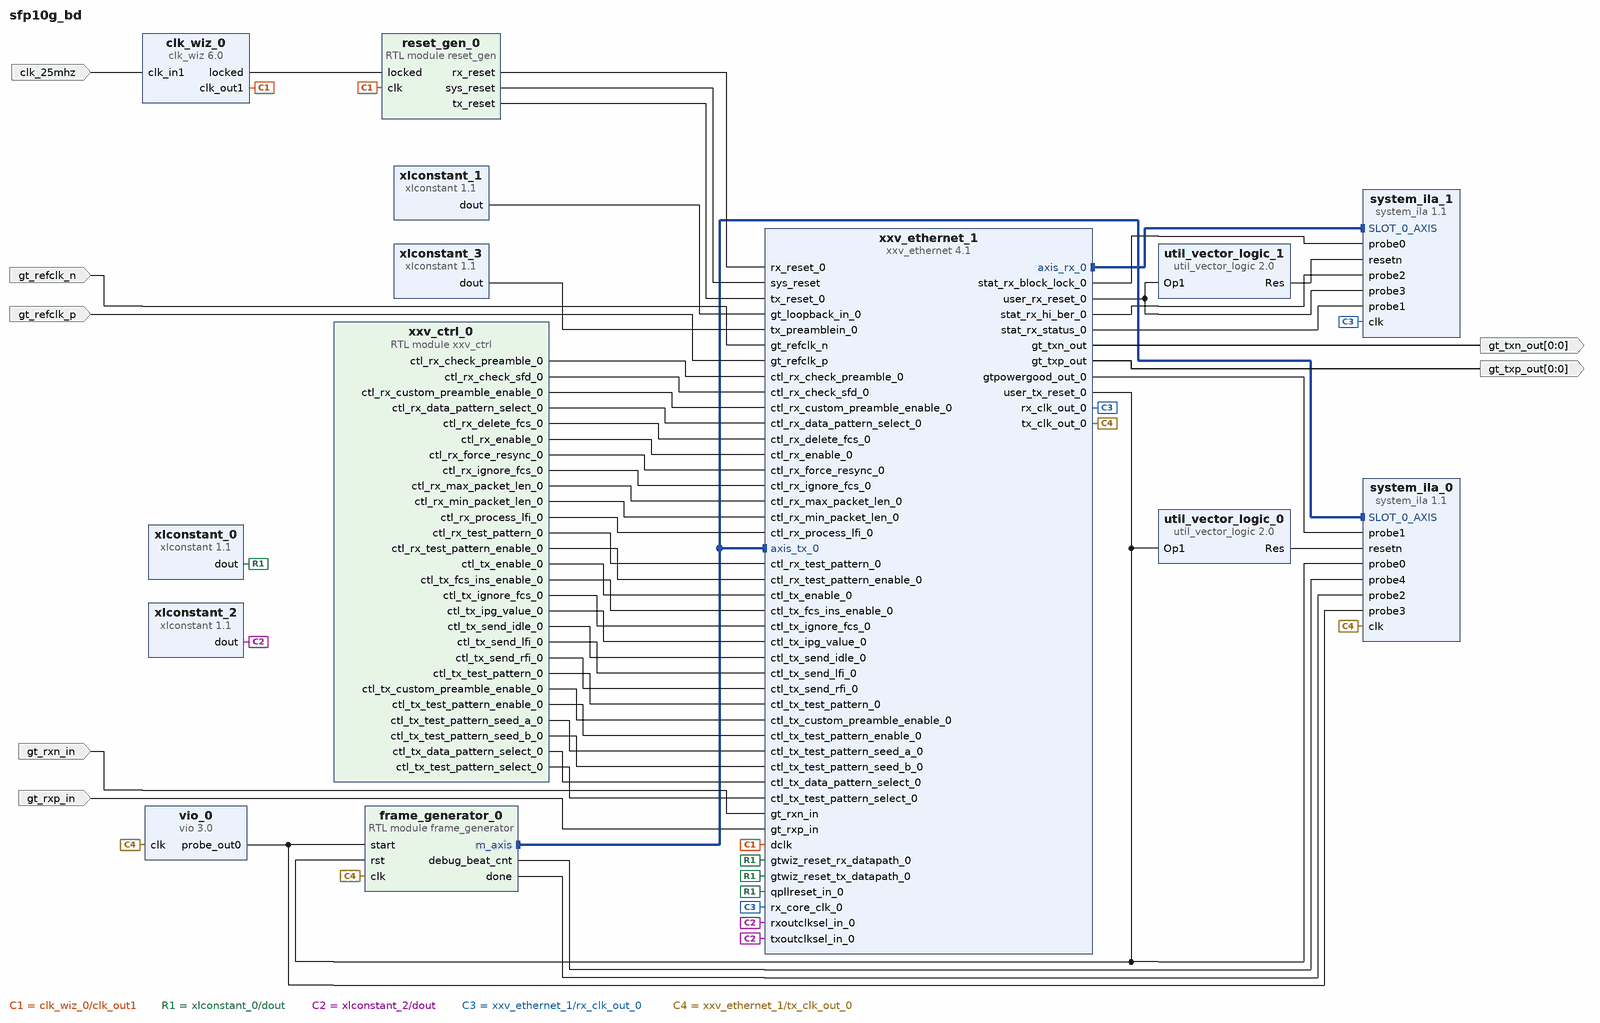
[diagram p0: block diagram of the top level]
# Vivado block design sfp10g_bd, xck26-sfvc784-2LV-c, Vivado 2022.2
create_bd_design sfp10g_bd

create_bd_port -dir I -type clk clk_25mhz
set_property -dict {CONFIG.FREQ_HZ 25000000} [get_bd_ports clk_25mhz]
create_bd_port -dir I -type clk gt_refclk_n
set_property -dict {CONFIG.FREQ_HZ 156250000} [get_bd_ports gt_refclk_n]
create_bd_port -dir I -type clk gt_refclk_p
set_property -dict {CONFIG.FREQ_HZ 156250000} [get_bd_ports gt_refclk_p]
create_bd_port -dir I gt_rxn_in
create_bd_port -dir I gt_rxp_in
create_bd_port -dir O -from 0 -to 0 gt_txn_out
create_bd_port -dir O -from 0 -to 0 gt_txp_out

create_bd_cell -type ip -vlnv xilinx.com:ip:clk_wiz:6.0 clk_wiz_0
set_property -dict [list \
  CONFIG.CLKIN1_JITTER_PS 400.0 \
  CONFIG.CLKOUT1_JITTER 190.517 \
  CONFIG.CLKOUT1_PHASE_ERROR 222.305 \
  CONFIG.MMCM_CLKFBOUT_MULT_F 48.000 \
  CONFIG.MMCM_CLKIN1_PERIOD 40.000 \
  CONFIG.MMCM_CLKIN2_PERIOD 10.0 \
  CONFIG.PRIM_IN_FREQ 25 \
  CONFIG.USE_LOCKED true \
  CONFIG.USE_RESET false \
] [get_bd_cells clk_wiz_0]
create_bd_cell -type module -reference reset_gen reset_gen_0
create_bd_cell -type ip -vlnv xilinx.com:ip:xlconstant:1.1 xlconstant_0
set_property -dict {CONFIG.CONST_VAL 0} [get_bd_cells xlconstant_0]
create_bd_cell -type ip -vlnv xilinx.com:ip:xlconstant:1.1 xlconstant_1
set_property -dict {CONFIG.CONST_VAL 0 CONFIG.CONST_WIDTH 3} [get_bd_cells xlconstant_1]
create_bd_cell -type ip -vlnv xilinx.com:ip:xlconstant:1.1 xlconstant_2
set_property -dict {CONFIG.CONST_VAL b101 CONFIG.CONST_WIDTH 3} [get_bd_cells xlconstant_2]
create_bd_cell -type ip -vlnv xilinx.com:ip:xlconstant:1.1 xlconstant_3
set_property -dict {CONFIG.CONST_VAL 0 CONFIG.CONST_WIDTH 56} [get_bd_cells xlconstant_3]
create_bd_cell -type module -reference xxv_ctrl xxv_ctrl_0
create_bd_cell -type ip -vlnv xilinx.com:ip:xxv_ethernet:4.1 xxv_ethernet_1
set_property -dict [list \
  CONFIG.BASE_R_KR BASE-R \
  CONFIG.INCLUDE_AXI4_INTERFACE 0 \
  CONFIG.LANE1_GT_LOC X0Y6 \
] [get_bd_cells xxv_ethernet_1]
create_bd_cell -type ip -vlnv xilinx.com:ip:vio:3.0 vio_0
set_property -dict {CONFIG.C_NUM_PROBE_IN 0} [get_bd_cells vio_0]
create_bd_cell -type ip -vlnv xilinx.com:ip:system_ila:1.1 system_ila_0
set_property -dict [list \
  CONFIG.C_DATA_DEPTH 4096 \
  CONFIG.C_MON_TYPE MIX \
  CONFIG.C_NUM_OF_PROBES 5 \
  CONFIG.C_SLOT_0_INTF_TYPE xilinx.com:interface:axis_rtl:1.0 \
] [get_bd_cells system_ila_0]
create_bd_cell -type ip -vlnv xilinx.com:ip:system_ila:1.1 system_ila_1
set_property -dict [list \
  CONFIG.C_DATA_DEPTH 4096 \
  CONFIG.C_MON_TYPE MIX \
  CONFIG.C_NUM_OF_PROBES 4 \
  CONFIG.C_SLOT_0_INTF_TYPE xilinx.com:interface:axis_rtl:1.0 \
] [get_bd_cells system_ila_1]
create_bd_cell -type ip -vlnv xilinx.com:ip:util_vector_logic:2.0 util_vector_logic_0
set_property -dict {CONFIG.C_OPERATION not CONFIG.C_SIZE 1} [get_bd_cells util_vector_logic_0]
create_bd_cell -type ip -vlnv xilinx.com:ip:util_vector_logic:2.0 util_vector_logic_1
set_property -dict {CONFIG.C_OPERATION not CONFIG.C_SIZE 1} [get_bd_cells util_vector_logic_1]
create_bd_cell -type module -reference frame_generator frame_generator_0

# ---- connections ----

connect_bd_intf_net [get_bd_intf_pins xxv_ethernet_1/axis_tx_0] [get_bd_intf_pins frame_generator_0/m_axis]
connect_bd_intf_net [get_bd_intf_pins xxv_ethernet_1/axis_tx_0] [get_bd_intf_pins system_ila_0/SLOT_0_AXIS]
connect_bd_intf_net [get_bd_intf_pins xxv_ethernet_1/axis_rx_0] [get_bd_intf_pins system_ila_1/SLOT_0_AXIS]
connect_bd_net [get_bd_ports clk_25mhz] [get_bd_pins clk_wiz_0/clk_in1]
connect_bd_net [get_bd_pins clk_wiz_0/clk_out1] [get_bd_pins reset_gen_0/clk] [get_bd_pins xxv_ethernet_1/dclk]
connect_bd_net [get_bd_pins clk_wiz_0/locked] [get_bd_pins reset_gen_0/locked]
connect_bd_net [get_bd_pins frame_generator_0/debug_beat_cnt] [get_bd_pins system_ila_0/probe4]
connect_bd_net [get_bd_pins frame_generator_0/done] [get_bd_pins system_ila_0/probe2]
connect_bd_net [get_bd_ports gt_refclk_n] [get_bd_pins xxv_ethernet_1/gt_refclk_n]
connect_bd_net [get_bd_ports gt_refclk_p] [get_bd_pins xxv_ethernet_1/gt_refclk_p]
connect_bd_net -net gt_rnx_in_1 [get_bd_ports gt_rxn_in] [get_bd_pins xxv_ethernet_1/gt_rxn_in]
connect_bd_net [get_bd_ports gt_rxp_in] [get_bd_pins xxv_ethernet_1/gt_rxp_in]
connect_bd_net [get_bd_pins reset_gen_0/rx_reset] [get_bd_pins xxv_ethernet_1/rx_reset_0]
connect_bd_net [get_bd_pins reset_gen_0/sys_reset] [get_bd_pins xxv_ethernet_1/sys_reset]
connect_bd_net [get_bd_pins reset_gen_0/tx_reset] [get_bd_pins xxv_ethernet_1/tx_reset_0]
connect_bd_net [get_bd_pins util_vector_logic_0/Res] [get_bd_pins system_ila_0/resetn]
connect_bd_net [get_bd_pins util_vector_logic_1/Res] [get_bd_pins system_ila_1/resetn]
connect_bd_net [get_bd_pins vio_0/probe_out0] [get_bd_pins system_ila_0/probe3] [get_bd_pins frame_generator_0/start]
connect_bd_net [get_bd_pins xlconstant_0/dout] \
  [get_bd_pins xxv_ethernet_1/gtwiz_reset_tx_datapath_0] [get_bd_pins xxv_ethernet_1/gtwiz_reset_rx_datapath_0] \
  [get_bd_pins xxv_ethernet_1/qpllreset_in_0]
connect_bd_net [get_bd_pins xlconstant_1/dout] [get_bd_pins xxv_ethernet_1/gt_loopback_in_0]
connect_bd_net [get_bd_pins xlconstant_2/dout] [get_bd_pins xxv_ethernet_1/txoutclksel_in_0] [get_bd_pins xxv_ethernet_1/rxoutclksel_in_0]
connect_bd_net [get_bd_pins xlconstant_3/dout] [get_bd_pins xxv_ethernet_1/tx_preamblein_0]
connect_bd_net [get_bd_pins xxv_ctrl_0/ctl_rx_check_preamble_0] [get_bd_pins xxv_ethernet_1/ctl_rx_check_preamble_0]
connect_bd_net [get_bd_pins xxv_ctrl_0/ctl_rx_check_sfd_0] [get_bd_pins xxv_ethernet_1/ctl_rx_check_sfd_0]
connect_bd_net [get_bd_pins xxv_ctrl_0/ctl_rx_custom_preamble_enable_0] [get_bd_pins xxv_ethernet_1/ctl_rx_custom_preamble_enable_0]
connect_bd_net [get_bd_pins xxv_ctrl_0/ctl_rx_data_pattern_select_0] [get_bd_pins xxv_ethernet_1/ctl_rx_data_pattern_select_0]
connect_bd_net [get_bd_pins xxv_ctrl_0/ctl_rx_delete_fcs_0] [get_bd_pins xxv_ethernet_1/ctl_rx_delete_fcs_0]
connect_bd_net [get_bd_pins xxv_ctrl_0/ctl_rx_enable_0] [get_bd_pins xxv_ethernet_1/ctl_rx_enable_0]
connect_bd_net [get_bd_pins xxv_ctrl_0/ctl_rx_force_resync_0] [get_bd_pins xxv_ethernet_1/ctl_rx_force_resync_0]
connect_bd_net [get_bd_pins xxv_ctrl_0/ctl_rx_ignore_fcs_0] [get_bd_pins xxv_ethernet_1/ctl_rx_ignore_fcs_0]
connect_bd_net [get_bd_pins xxv_ctrl_0/ctl_rx_max_packet_len_0] [get_bd_pins xxv_ethernet_1/ctl_rx_max_packet_len_0]
connect_bd_net [get_bd_pins xxv_ctrl_0/ctl_rx_min_packet_len_0] [get_bd_pins xxv_ethernet_1/ctl_rx_min_packet_len_0]
connect_bd_net [get_bd_pins xxv_ctrl_0/ctl_rx_process_lfi_0] [get_bd_pins xxv_ethernet_1/ctl_rx_process_lfi_0]
connect_bd_net [get_bd_pins xxv_ctrl_0/ctl_rx_test_pattern_0] [get_bd_pins xxv_ethernet_1/ctl_rx_test_pattern_0]
connect_bd_net [get_bd_pins xxv_ctrl_0/ctl_rx_test_pattern_enable_0] [get_bd_pins xxv_ethernet_1/ctl_rx_test_pattern_enable_0]
connect_bd_net [get_bd_pins xxv_ctrl_0/ctl_tx_enable_0] [get_bd_pins xxv_ethernet_1/ctl_tx_enable_0]
connect_bd_net [get_bd_pins xxv_ctrl_0/ctl_tx_fcs_ins_enable_0] [get_bd_pins xxv_ethernet_1/ctl_tx_fcs_ins_enable_0]
connect_bd_net [get_bd_pins xxv_ctrl_0/ctl_tx_ignore_fcs_0] [get_bd_pins xxv_ethernet_1/ctl_tx_ignore_fcs_0]
connect_bd_net [get_bd_pins xxv_ctrl_0/ctl_tx_ipg_value_0] [get_bd_pins xxv_ethernet_1/ctl_tx_ipg_value_0]
connect_bd_net [get_bd_pins xxv_ctrl_0/ctl_tx_send_idle_0] [get_bd_pins xxv_ethernet_1/ctl_tx_send_idle_0]
connect_bd_net [get_bd_pins xxv_ctrl_0/ctl_tx_send_lfi_0] [get_bd_pins xxv_ethernet_1/ctl_tx_send_lfi_0]
connect_bd_net [get_bd_pins xxv_ctrl_0/ctl_tx_send_rfi_0] [get_bd_pins xxv_ethernet_1/ctl_tx_send_rfi_0]
connect_bd_net [get_bd_pins xxv_ctrl_0/ctl_tx_test_pattern_0] [get_bd_pins xxv_ethernet_1/ctl_tx_test_pattern_0]
connect_bd_net -net xxv_ctrl_0_ctl_tx_test_pattern_enable [get_bd_pins xxv_ctrl_0/ctl_tx_custom_preamble_enable_0] \
  [get_bd_pins xxv_ethernet_1/ctl_tx_custom_preamble_enable_0]
connect_bd_net [get_bd_pins xxv_ctrl_0/ctl_tx_test_pattern_enable_0] [get_bd_pins xxv_ethernet_1/ctl_tx_test_pattern_enable_0]
connect_bd_net [get_bd_pins xxv_ctrl_0/ctl_tx_test_pattern_seed_a_0] [get_bd_pins xxv_ethernet_1/ctl_tx_test_pattern_seed_a_0]
connect_bd_net [get_bd_pins xxv_ctrl_0/ctl_tx_test_pattern_seed_b_0] [get_bd_pins xxv_ethernet_1/ctl_tx_test_pattern_seed_b_0]
connect_bd_net -net xxv_ctrl_0_ctl_tx_test_pattern_select [get_bd_pins xxv_ctrl_0/ctl_tx_data_pattern_select_0] \
  [get_bd_pins xxv_ethernet_1/ctl_tx_data_pattern_select_0]
connect_bd_net [get_bd_pins xxv_ctrl_0/ctl_tx_test_pattern_select_0] [get_bd_pins xxv_ethernet_1/ctl_tx_test_pattern_select_0]
connect_bd_net [get_bd_pins xxv_ethernet_1/gt_txn_out] [get_bd_ports gt_txn_out]
connect_bd_net [get_bd_pins xxv_ethernet_1/gt_txp_out] [get_bd_ports gt_txp_out]
connect_bd_net [get_bd_pins xxv_ethernet_1/gtpowergood_out_0] [get_bd_pins system_ila_0/probe1]
connect_bd_net [get_bd_pins xxv_ethernet_1/rx_clk_out_0] [get_bd_pins xxv_ethernet_1/rx_core_clk_0] [get_bd_pins system_ila_1/clk]
connect_bd_net [get_bd_pins xxv_ethernet_1/stat_rx_block_lock_0] [get_bd_pins system_ila_1/probe0]
connect_bd_net [get_bd_pins xxv_ethernet_1/stat_rx_hi_ber_0] [get_bd_pins system_ila_1/probe2]
connect_bd_net [get_bd_pins xxv_ethernet_1/stat_rx_status_0] [get_bd_pins system_ila_1/probe1]
connect_bd_net [get_bd_pins xxv_ethernet_1/tx_clk_out_0] [get_bd_pins vio_0/clk] [get_bd_pins system_ila_0/clk] [get_bd_pins frame_generator_0/clk]
connect_bd_net [get_bd_pins xxv_ethernet_1/user_rx_reset_0] [get_bd_pins system_ila_1/probe3] [get_bd_pins util_vector_logic_1/Op1]
connect_bd_net [get_bd_pins xxv_ethernet_1/user_tx_reset_0] \
  [get_bd_pins system_ila_0/probe0] [get_bd_pins util_vector_logic_0/Op1] [get_bd_pins frame_generator_0/rst]

validate_bd_design
save_bd_design
